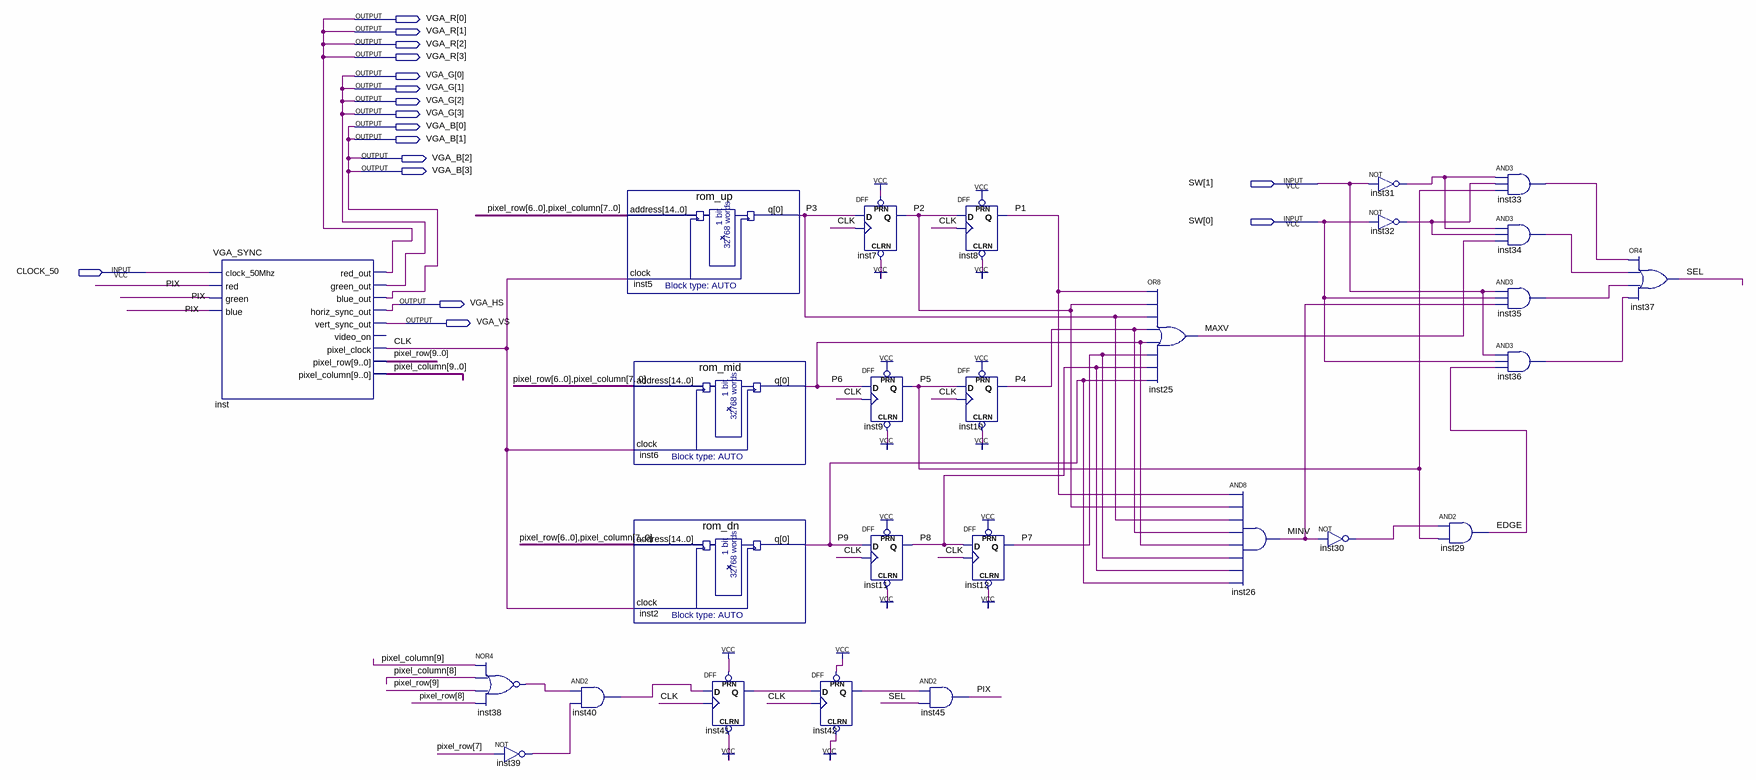
[diagram p0: schematic sheet]
// Quartus schematic filtro_ruido.bdf as structural Verilog: 27 symbols, 17 pins
module filtro_ruido (
  input  [1:0] SW,
  input  CLOCK_50,
  output [3:0] VGA_R,
  output [3:0] VGA_G,
  output [3:0] VGA_B,
  output VGA_HS,
  output VGA_VS
);

  wire CLK, EDGE, inst30_out, inst31_out, inst32_out, inst33_out, inst34_out, inst35_out, inst36_out,
       inst38_out, inst39_out, inst40_out, inst41_q, inst42_q, MAXV, MINV, P1, P2, P3, P4, P5, P6, P7, P8,
       P9, PIX, SEL;
  wire [9:0] pixel_column, pixel_row;

  VGA_SYNC inst (
    .clock_50Mhz(CLOCK_50), .red(PIX), .green(PIX), .blue(PIX), .red_out(VGA_R[3]), .green_out(VGA_G[3]),
    .blue_out(VGA_B[3]), .horiz_sync_out(VGA_HS), .vert_sync_out(VGA_VS), .pixel_clock(CLK),
    .pixel_row(pixel_row), .pixel_column(pixel_column));  // open: video_on
  nor inst38 (inst38_out, pixel_column[9], pixel_column[8], pixel_row[9], pixel_row[8]);
  not inst39 (inst39_out, pixel_row[7]);
  and inst40 (inst40_out, inst38_out, inst39_out);
  rom_up inst5 (.address({pixel_row[6:0], pixel_column[7:0]}), .clock(CLK), .q(P3));
  rom_mid inst6 (.address({pixel_row[6:0], pixel_column[7:0]}), .clock(CLK), .q(P6));
  rom_dn inst2 (.address({pixel_row[6:0], pixel_column[7:0]}), .clock(CLK), .q(P9));
  DFF inst41 (.CLRN(1'b1), .CLK(CLK), .D(inst40_out), .PRN(1'b1), .Q(inst41_q));
  DFF inst7 (.CLRN(1'b1), .CLK(CLK), .D(P3), .PRN(1'b1), .Q(P2));
  DFF inst42 (.CLRN(1'b1), .CLK(CLK), .D(inst41_q), .PRN(1'b1), .Q(inst42_q));
  DFF inst9 (.CLRN(1'b1), .CLK(CLK), .D(P6), .PRN(1'b1), .Q(P5));
  DFF inst11 (.CLRN(1'b1), .CLK(CLK), .D(P9), .PRN(1'b1), .Q(P8));
  DFF inst8 (.CLRN(1'b1), .CLK(CLK), .D(P2), .PRN(1'b1), .Q(P1));
  DFF inst10 (.CLRN(1'b1), .CLK(CLK), .D(P5), .PRN(1'b1), .Q(P4));
  and inst45 (PIX, inst42_q, SEL);
  DFF inst12 (.CLRN(1'b1), .CLK(CLK), .D(P8), .PRN(1'b1), .Q(P7));
  or inst25 (MAXV, P1, P2, P3, P4, P6, P7, P8, P9);
  and inst26 (MINV, P1, P2, P3, P4, P6, P7, P8, P9);
  not inst30 (inst30_out, MINV);
  not inst31 (inst31_out, SW[1]);
  not inst32 (inst32_out, SW[0]);
  and inst29 (EDGE, inst30_out, P5);
  and inst33 (inst33_out, inst31_out, inst32_out, P5);
  and inst34 (inst34_out, inst31_out, inst32_out, MAXV);
  and inst35 (inst35_out, SW[1], SW[0], MINV);
  and inst36 (inst36_out, SW[1], SW[0], EDGE);
  or inst37 (SEL, inst33_out, inst34_out, inst35_out, inst36_out);

  assign VGA_B[2:0] = {3{VGA_B[3]}};
  assign VGA_G[2:0] = {3{VGA_G[3]}};
  assign VGA_R[2:0] = {3{VGA_R[3]}};
endmodule
